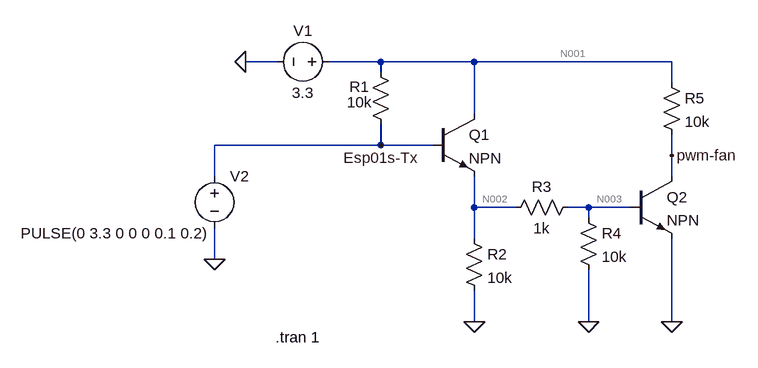
[diagram p0: schematic lt-spice-sim.asc]
lt-spice-sim.asc, the LTspice schematic file:
Version 4
SHEET 1 880 680
WIRE -96 -32 -144 -32
WIRE 64 -32 -16 -32
WIRE 208 -32 64 -32
WIRE 512 -32 208 -32
WIRE 64 -16 64 -32
WIRE 512 0 512 -32
WIRE 208 48 208 -32
WIRE 64 96 64 64
WIRE 64 96 -192 96
WIRE 144 96 64 96
WIRE 512 112 512 80
WIRE -192 144 -192 96
WIRE 512 144 512 112
WIRE 208 192 208 144
WIRE 272 192 208 192
WIRE 384 192 352 192
WIRE 448 192 384 192
WIRE 384 208 384 192
WIRE 208 240 208 192
WIRE -192 272 -192 224
WIRE 208 368 208 320
WIRE 384 368 384 288
WIRE 512 368 512 240
FLAG -144 -32 0
FLAG 208 368 0
FLAG 384 368 0
FLAG 512 368 0
FLAG 64 96 Esp01s-Tx
FLAG -192 272 0
FLAG 512 112 pwm-fan
SYMBOL npn 144 48 R0
SYMATTR InstName Q1
SYMBOL npn 448 144 R0
SYMATTR InstName Q2
SYMBOL voltage 0 -32 R90
WINDOW 0 -32 56 VBottom 2
WINDOW 3 32 56 VTop 2
SYMATTR InstName V1
SYMATTR Value 3.3
SYMBOL res 48 -32 R0
WINDOW 0 -32 38 Left 2
WINDOW 3 -36 62 Left 2
SYMATTR InstName R1
SYMATTR Value 10k
SYMBOL res 192 224 R0
SYMATTR InstName R2
SYMATTR Value 10k
SYMBOL res 368 176 R90
WINDOW 0 0 56 VBottom 2
WINDOW 3 32 56 VTop 2
SYMATTR InstName R3
SYMATTR Value 1k
SYMBOL res 368 192 R0
SYMATTR InstName R4
SYMATTR Value 10k
SYMBOL res 496 -16 R0
SYMATTR InstName R5
SYMATTR Value 10k
SYMBOL voltage -192 128 R0
WINDOW 3 -8 104 Right 2
WINDOW 123 0 0 Left 0
WINDOW 39 0 0 Left 0
SYMATTR InstName V2
SYMATTR Value PULSE(0 3.3 0 0 0 0.1 0.2)
TEXT -98 392 Left 2 !.tran 1

The netlist it stands for:
* lt-spice-sim.asc
Q1 N001 Esp01s-Tx N002 0 NPN
Q2 pwm-fan N003 0 0 NPN
V1 N001 0 3.3
R1 N001 Esp01s-Tx 10k
R2 N002 0 10k
R3 N003 N002 1k
R4 N003 0 10k
R5 N001 pwm-fan 10k
V2 Esp01s-Tx 0 PULSE(0 3.3 0 0 0 0.1 0.2)
.model NPN NPN
.model PNP PNP
.lib standard.bjt
.tran 1
.backanno
.end

* Results of the author's LTspice run, read from the files saved beside the schematic
* Operating Point, zero values left out:
*   V(n001) = 3.3 V
*   V(n002) = 15.72 nV
*   V(pwm-fan) = 3.3 V
*   V(n003) = 17.29 nV
*   Ic(Q2) = 3.3 pA
*   Ib(Q2) = -3.3 pA
*   Ic(Q1) = 3.3 pA
*   Ib(Q1) = -3.3 pA
*   I(R5) = 3.3 pA
*   I(R4) = 1.729 pA
*   I(R3) = 1.571 pA
*   I(R2) = 1.572 pA
*   I(R1) = 330 µA
*   I(V2) = 330 µA
*   I(V1) = -330 µA
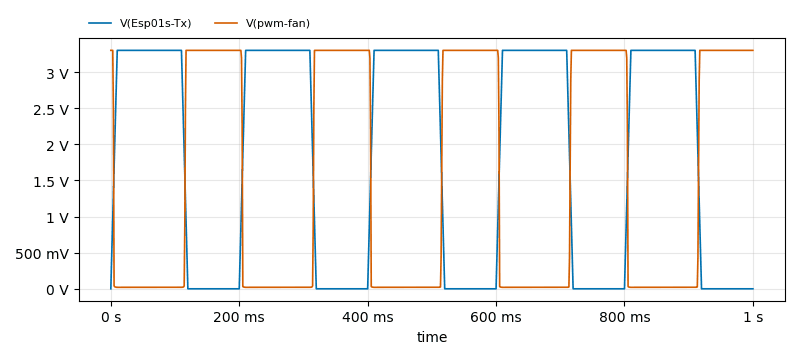
[diagram p1: Transient Analysis of lt-spice-sim.asc, plotted from the saved traces]
* Transient Analysis, 1 run:
*   V(Esp01s-Tx): min 0 V, max 3.3 V, average 1.815 V, rms 2.41 V, last 0 V
*   V(pwm-fan): min 20.46 mV, max 3.3 V, average 1.481 V, rms 2.194 V, last 3.3 V